# Altium schematic sheet Ground-Fault-Detect-Sheet-3.SchDoc (part 3 of 3)
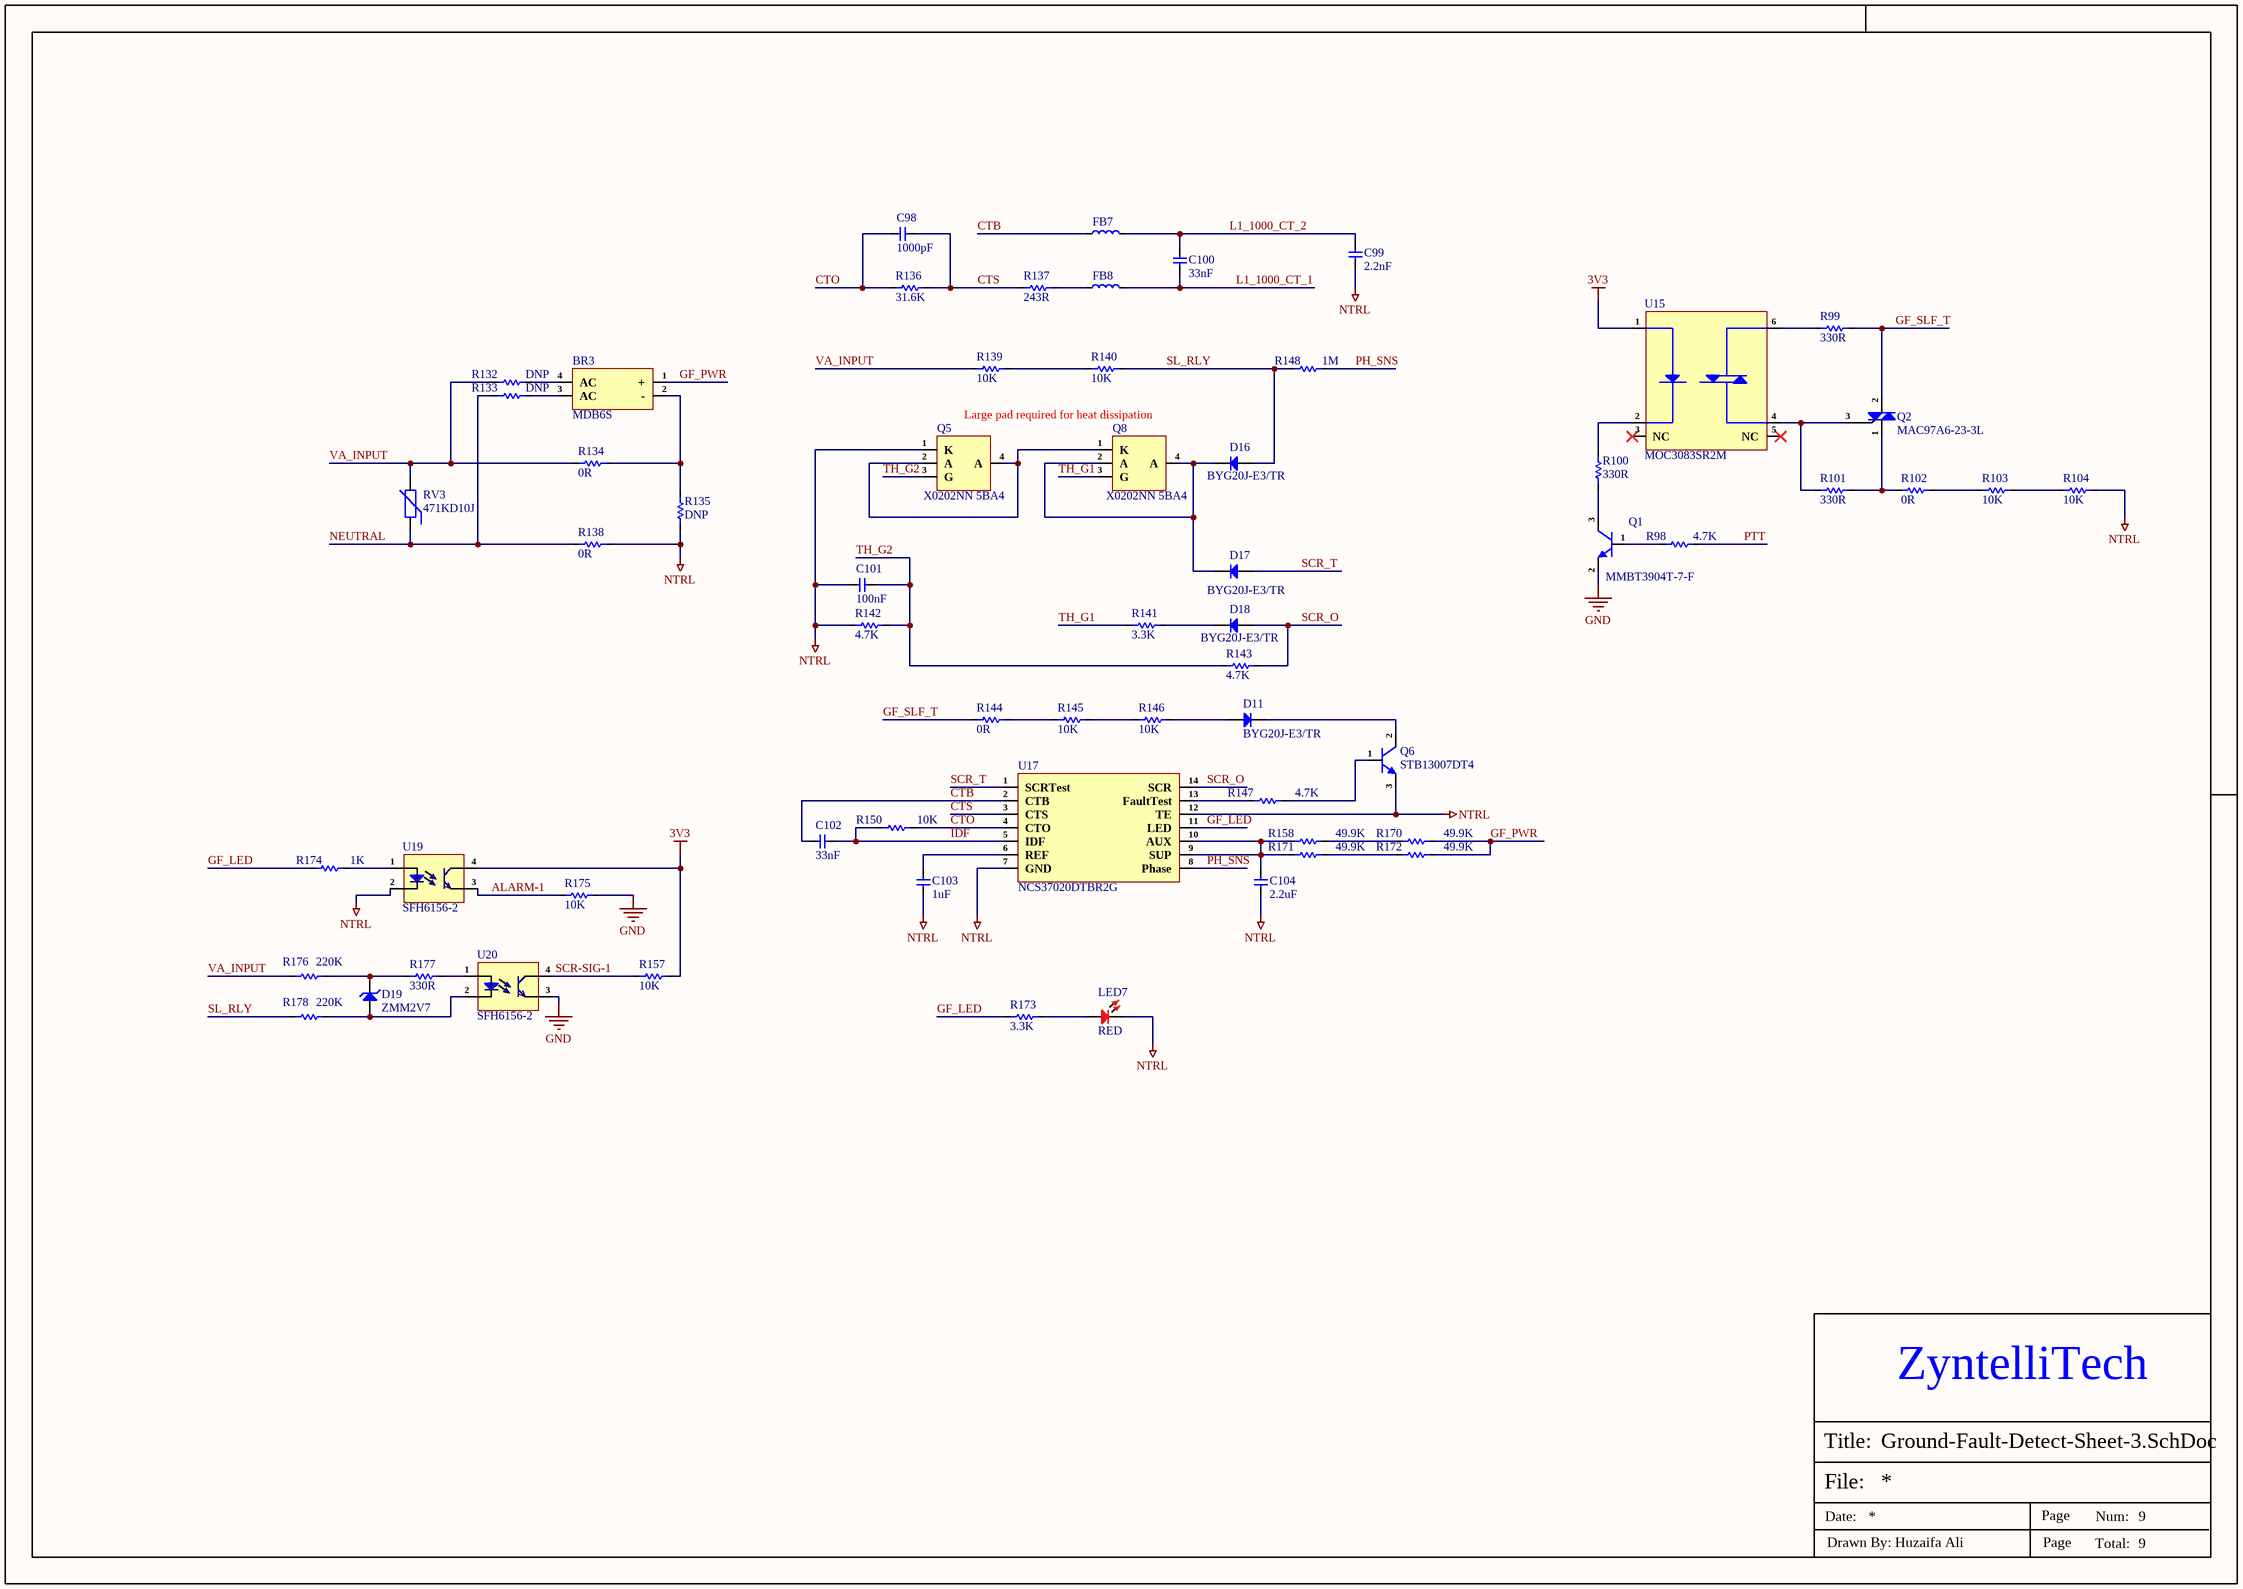
[diagram p2: Ground-Fault-Detect-Sheet-3.SchDoc]

## Library data of the parts (continued)
U15 = MOC3083SR2M: OPTOISOLATOR 4.17KV TRIAC 6SMD; Manufacturer: ON Semiconductor / Fairchild; Number of Channels: 1; Hold Current: 500uA; Nominal Supply Voltage: 1.3V; Max Supply Voltage: 1.5V; Forward Current: 60mA; Output Voltage: 800V; Reverse Breakdown Voltage: 6V; Max Power Dissipation: 250mW; Isolation Voltage: 4.2kV; Isolation Voltage-Max: 7.5kV; Item Type: IC; Supplier: Future Electronics; LCSC Part Number: C111561; Manufacturer Part Number: MOC3083SR2M; RoHS: Yes; Stock: 26000; Pricing: 1000=0.365, 2000=0.355, 3000=0.35, 4000=0.345, 5000=0.335 (USD); Mounting Technology: Surface Mount; Case/Package: SMD/SMT; Pins: 6; Weight: 0.81g; Min Operating Temperature: -40°C; Max Operating Temperature: 85°C; Packaging: Tape and Reel; Forward Voltage: 1.3V; Max Input Current: 60mA; Number of Elements: 1; Power Dissipation: 250mW; Max Output Voltage: 800V; Input Current: 60mA; Number of Circuits: 1; Series: -; Reverse Voltage: 6V; Height: 4.8mm; Radiation Hardening: No; Reach SVHC Compliant: No; Lead Free: Lead Free; RoHS Compliant: Yes; ComponentLink1URL: https://datasheet.ciiva.com/25620/0900766b810df541-25620726.pdf?src-supplier=Rs; ComponentLink1Description: https://datasheet.ciiva.com/25620/0900766b810df541-25620726.pdf?src-supplier=Rs; ComponentLink2URL: https://datasheet.ciiva.com/15118/getdatasheetpartid-67311-15118215.pdf?src-supplier=Verical; ComponentLink2Description: https://datasheet.ciiva.com/15118/getdatasheetpartid-67311-15118215.pdf?src-supplier=Verical; ComponentLink3URL: https://datasheet.ciiva.com/2093/moc3083m-2093280.pdf?src-supplier=Digikey; ComponentLink3Description: https://datasheet.ciiva.com/2093/moc3083m-2093280.pdf?src-supplier=Digikey; ComponentLink4URL: https://datasheet.ciiva.com/16744/moc3083m-16744701.pdf?src-supplier=Future+Electronics; ComponentLink4Description: https://datasheet.ciiva.com/16744/moc3083m-16744701.pdf?src-supplier=Future+Electronics; ComponentLink5URL: https://datasheet.ciiva.com/8099/moc3081m-8099621.pdf?src-supplier=Avnet; ComponentLink5Description: https://datasheet.ciiva.com/8099/moc3081m-8099621.pdf?src-supplier=Avnet; ComponentLink6URL: https://datasheet.ciiva.com/2093/moc3083m-2093279.pdf?src-supplier=Digikey; ComponentLink6Description: https://datasheet.ciiva.com/2093/moc3083m-2093279.pdf?src-supplier=Digikey; ComponentLink7URL: https://datasheet.ciiva.com/2093/moc3083m-2093278.pdf?src-supplier=Digikey; ComponentLink7Description: https://datasheet.ciiva.com/2093/moc3083m-2093278.pdf?src-supplier=Digikey
U17 = NCS37020DTBR2G: IC SIGNAL PROCESSOR 14TSSOP; Manufacturer: onsemi; Manufacturer Lifecycle Status: ACTIVE; Item Type: Sensor and Detector Interfaces; Max Supply Current: 10mA; Max Supply Voltage: 13V; Operating Supply Voltage: 12V; Supplier: DigiKey; LCSC Part Number: C904570; Manufacturer Part Number: NCS37020DTBR2G; RoHS: Compliant; Stock: 2623; Pricing: 1=0.99, 10=0.713, 25=0.6436, 100=0.5668, 250=0.53028, 500=0.50824, 1000=0.4901 (USD); China RoHS: Compliant; Height - Seated (Max): 1.2mm; Length: 5mm; Lifecycle Status: Production; Max Operating Temperature: 70°C; Min Operating Temperature: 0°C; Number of Terminals: 14; REACH SVHC: Yes; Terminal Pitch: 650µm; Width: 4.4mm; ComponentLink1URL: https://datasheet.octopart.com:443/NCS37020DTBR2G-onsemi-datasheet-180965843.pdf?src-supplier=IHS; ComponentLink1Description: https://datasheet.octopart.com:443/NCS37020DTBR2G-onsemi-datasheet-180965843.pdf?src-supplier=IHS; ComponentLink2URL: https://datasheet.octopart.com:443/NCS37020DTBR2G-ON-Semiconductor-datasheet-139012421.pdf?src-supplier=Master+Electronics; ComponentLink2Description: https://datasheet.octopart.com:443/NCS37020DTBR2G-ON-Semiconductor-datasheet-139012421.pdf?src-supplier=Master+Electronics; ComponentLink3URL: https://datasheet.octopart.com:443/NCS37020DTBR2G-ON-Semiconductor-datasheet-137129895.pdf?src-supplier=onsemi; ComponentLink3Description: https://datasheet.octopart.com:443/NCS37020DTBR2G-ON-Semiconductor-datasheet-137129895.pdf?src-supplier=onsemi; ComponentLink4URL: http://sigma.octopart.com:80/reach_statement/ON-Semiconductor-company-79.pdf?src-supplier=Compliance+Statements; ComponentLink4Description: http://sigma.octopart.com:80/reach_statement/ON-Semiconductor-company-79.pdf?src-supplier=Compliance+Statements; ComponentLink5URL: https://octopart.com:443/opatz8j6/c1?t=ZQW9HMtH4k71rWyV6AJY4tuW3XheiTOPmjmobTXB_F26sMcwWMhmH10pq7sQJYBRXfGSHYWRpmqpvFarTcJ6IR5mJHNE_a9wC_wytZDRLioJeZ7QsJAeRfWIGI1BjBRFqUYimvJtzLjCjz17RDpSBx7XSL-tIesgpAoA9dkWd1QvjggH5Lf3PglFk8Jmj008jqbUnKitEB1RpbYA_80My9UupV7zL5uwbriqM9u8ka-eDVP0HHlgEyvlk90TkPkxt1apKx9jOG4F6f6WcXkBfOtrxuHJ_x8hryS4-VTjD0u0BN_yaFUAv4LE__5U5qDUiotF1QbODTNZ71WeSvwhQDdPzE4qpMHglnhuqzT235XeMYg&src-supplier=Compliance+Statements; ComponentLink5Description: https://octopart.com:443/opatz8j6/c1?t=ZQW9HMtH4k71rWyV6AJY4tuW3XheiTOPmjmobTXB_F26sMcwWMhmH10pq7sQJYBRXfGSHYWRpmqpvFarTcJ6IR5mJHNE_a9wC_wytZDRLioJeZ7QsJAeRfWIGI1BjBRFqUYimvJtzLjCjz17RDpSBx7XSL-tIesgpAoA9dkWd1QvjggH5Lf3PglFk8Jmj008jqbUnKitEB1RpbYA_80My9UupV7zL5uwbriqM9u8ka-eDVP0HHlgEyvlk90TkPkxt1apKx9jOG4F6f6WcXkBfOtrxuHJ_x8hryS4-VTjD0u0BN_yaFUAv4LE__5U5qDUiotF1QbODTNZ71WeSvwhQDdPzE4qpMHglnhuqzT235XeMYg&src-supplier=Compliance+Statements; ComponentLink6URL: https://octopart.com:443/opatz8j6/c1?t=HismN954h6fGmh9fmuQcgXhTaW1LIpJi1zfdE4ekLkTpZNiJX5OuPT8uhS35awRxYVrPSlueGbHyRXMTAgi5oFyNekVsRZ8Wf8rZ0DBuUfKFuVTFVFD9ObD5jmIONxQZYnS7ApbkheX8jjM_HLR7wXao3cq_nbkOSh1zihM_Cb25b-mOFKzO57l-cPraBIcXhIIoS2L5CzwghySSn828_I70UIOuSkvLkmcdjxM7wbVRBzaqQtktMNEHz6OXR8jKrzYQQpbeYqdyN6vjnc-d046VHgn1wFMO-_Mp3x6HmAFm7wxh74XFnntKtcXzz-IGW-eRo0i-X4dDM8t3zvT-QSalQbhBf0_OjmbV5ssDUWXnLg&src-supplier=Compliance+Statements; ComponentLink6Description: https://octopart.com:443/opatz8j6/c1?t=HismN954h6fGmh9fmuQcgXhTaW1LIpJi1zfdE4ekLkTpZNiJX5OuPT8uhS35awRxYVrPSlueGbHyRXMTAgi5oFyNekVsRZ8Wf8rZ0DBuUfKFuVTFVFD9ObD5jmIONxQZYnS7ApbkheX8jjM_HLR7wXao3cq_nbkOSh1zihM_Cb25b-mOFKzO57l-cPraBIcXhIIoS2L5CzwghySSn828_I70UIOuSkvLkmcdjxM7wbVRBzaqQtktMNEHz6OXR8jKrzYQQpbeYqdyN6vjnc-d046VHgn1wFMO-_Mp3x6HmAFm7wxh74XFnntKtcXzz-IGW-eRo0i-X4dDM8t3zvT-QSalQbhBf0_OjmbV5ssDUWXnLg&src-supplier=Compliance+Statements
U19 U20 = SFH6156-2: OPTOISOLATOR 5.3KV TRANS 4SMD; Manufacturer: Vishay; Item Type: IC; Supplier: Mouser; LCSC Part Number: C5156027; Manufacturer Part Number: SFH6156-2; RoHS: No; Stock: 11480; Pricing: 1=0.56, 10=0.37, 50=0.37, 100=0.253, 1000=0.218, 10000=0.217 (USD)